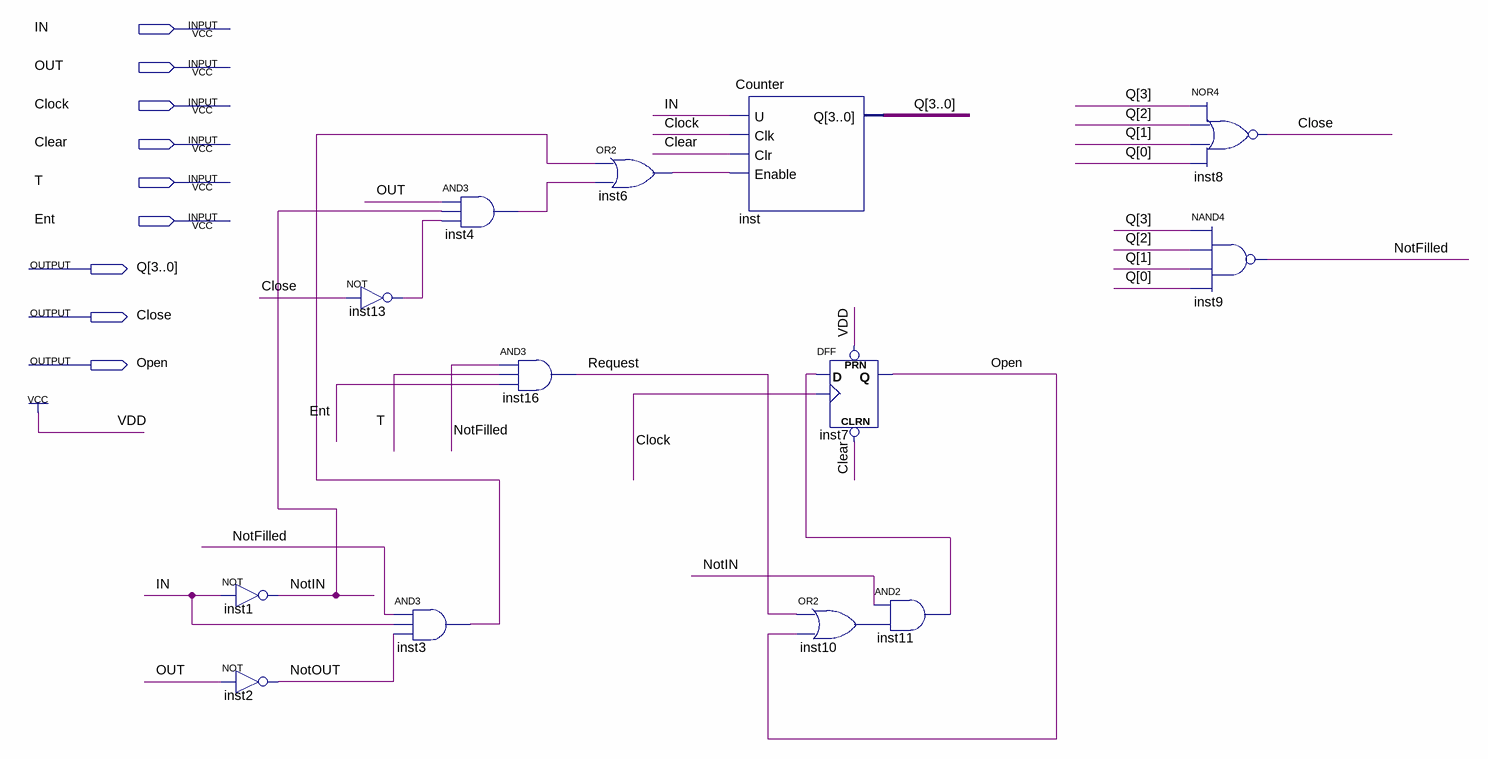
[diagram p0: schematic sheet]
// Quartus schematic Circut.bdf as structural Verilog: 13 symbols, 9 pins
module Circut (
  input  IN,
  input  OUT,
  input  Clock,
  input  Clear,
  input  T,
  input  Ent,
  output [3:0] Q,
  output Close,
  output Open
);

  wire inst3_out, inst4_out, inst6_out, inst10_out, inst11_out, inst13_out, NotFilled, NotIN, NotOUT, Request;

  not inst1 (NotIN, IN);
  not inst2 (NotOUT, OUT);
  not inst13 (inst13_out, Close);
  and inst3 (inst3_out, NotFilled, IN, NotOUT);
  and inst4 (inst4_out, OUT, NotIN, inst13_out);
  and inst16 (Request, NotFilled, T, Ent);
  or inst6 (inst6_out, inst3_out, inst4_out);
  Counter inst (.U(IN), .Clk(Clock), .Clr(Clear), .Enable(inst6_out), .Q(Q));
  or inst10 (inst10_out, Request, Open);
  DFF inst7 (.CLRN(Clear), .CLK(Clock), .D(inst11_out), .PRN(1'b1), .Q(Open));
  and inst11 (inst11_out, NotIN, inst10_out);
  nor inst8 (Close, Q[3], Q[2], Q[1], Q[0]);
  nand inst9 (NotFilled, Q[3], Q[2], Q[1], Q[0]);
endmodule
